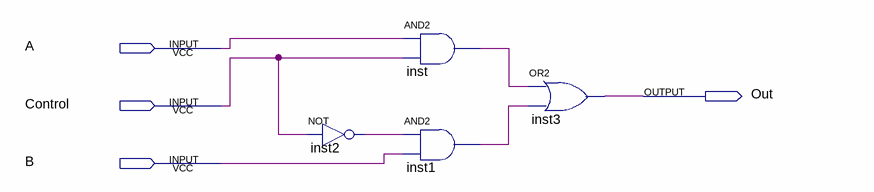
[diagram p0: schematic sheet]
// Quartus schematic Multiplex.bdf as structural Verilog: 4 symbols, 4 pins
module Multiplex (
  input  A,
  input  Control,
  input  B,
  output Out
);

  wire inst1_out, inst2_out, inst_out;

  not inst2 (inst2_out, Control);
  and inst (inst_out, A, Control);
  and inst1 (inst1_out, inst2_out, B);
  or inst3 (Out, inst_out, inst1_out);
endmodule
